# EAGLE schematic FRIDAY_Compute_SCH4b (EAGLE 9.6.2), part 3 of 3
## Sheet 10 of 11
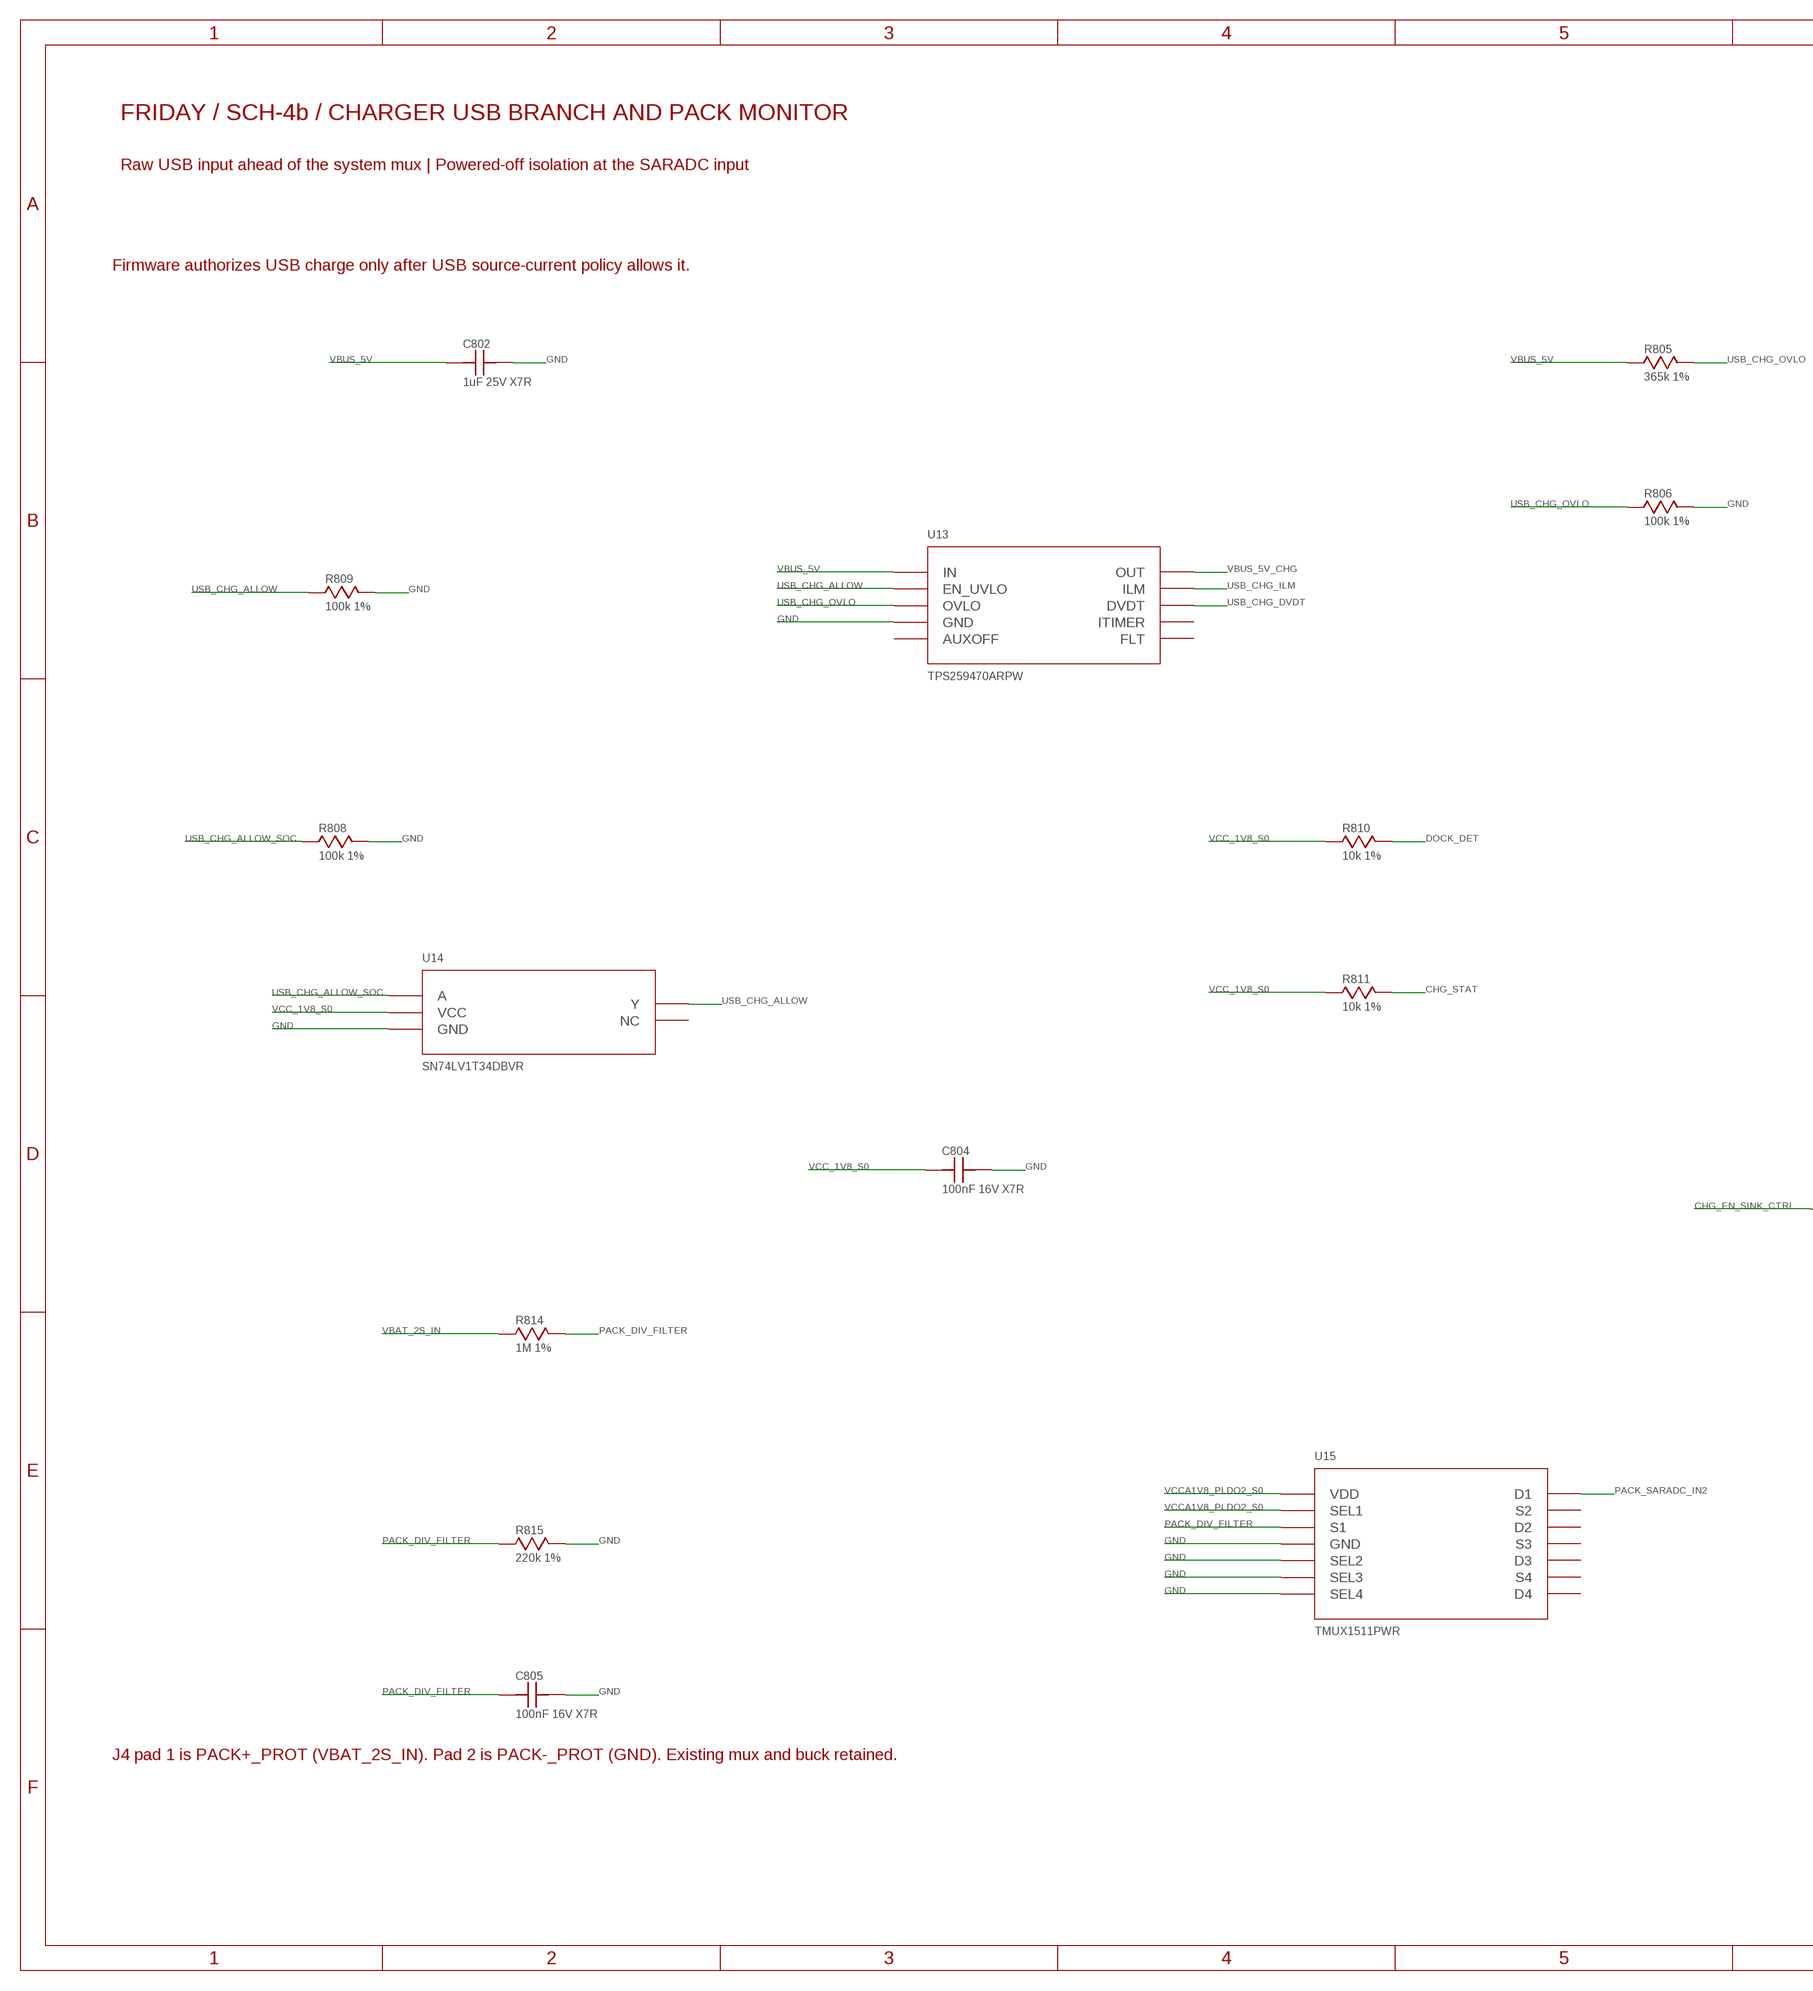
[diagram p27: schematic, sheet 10, part 1 of 2]
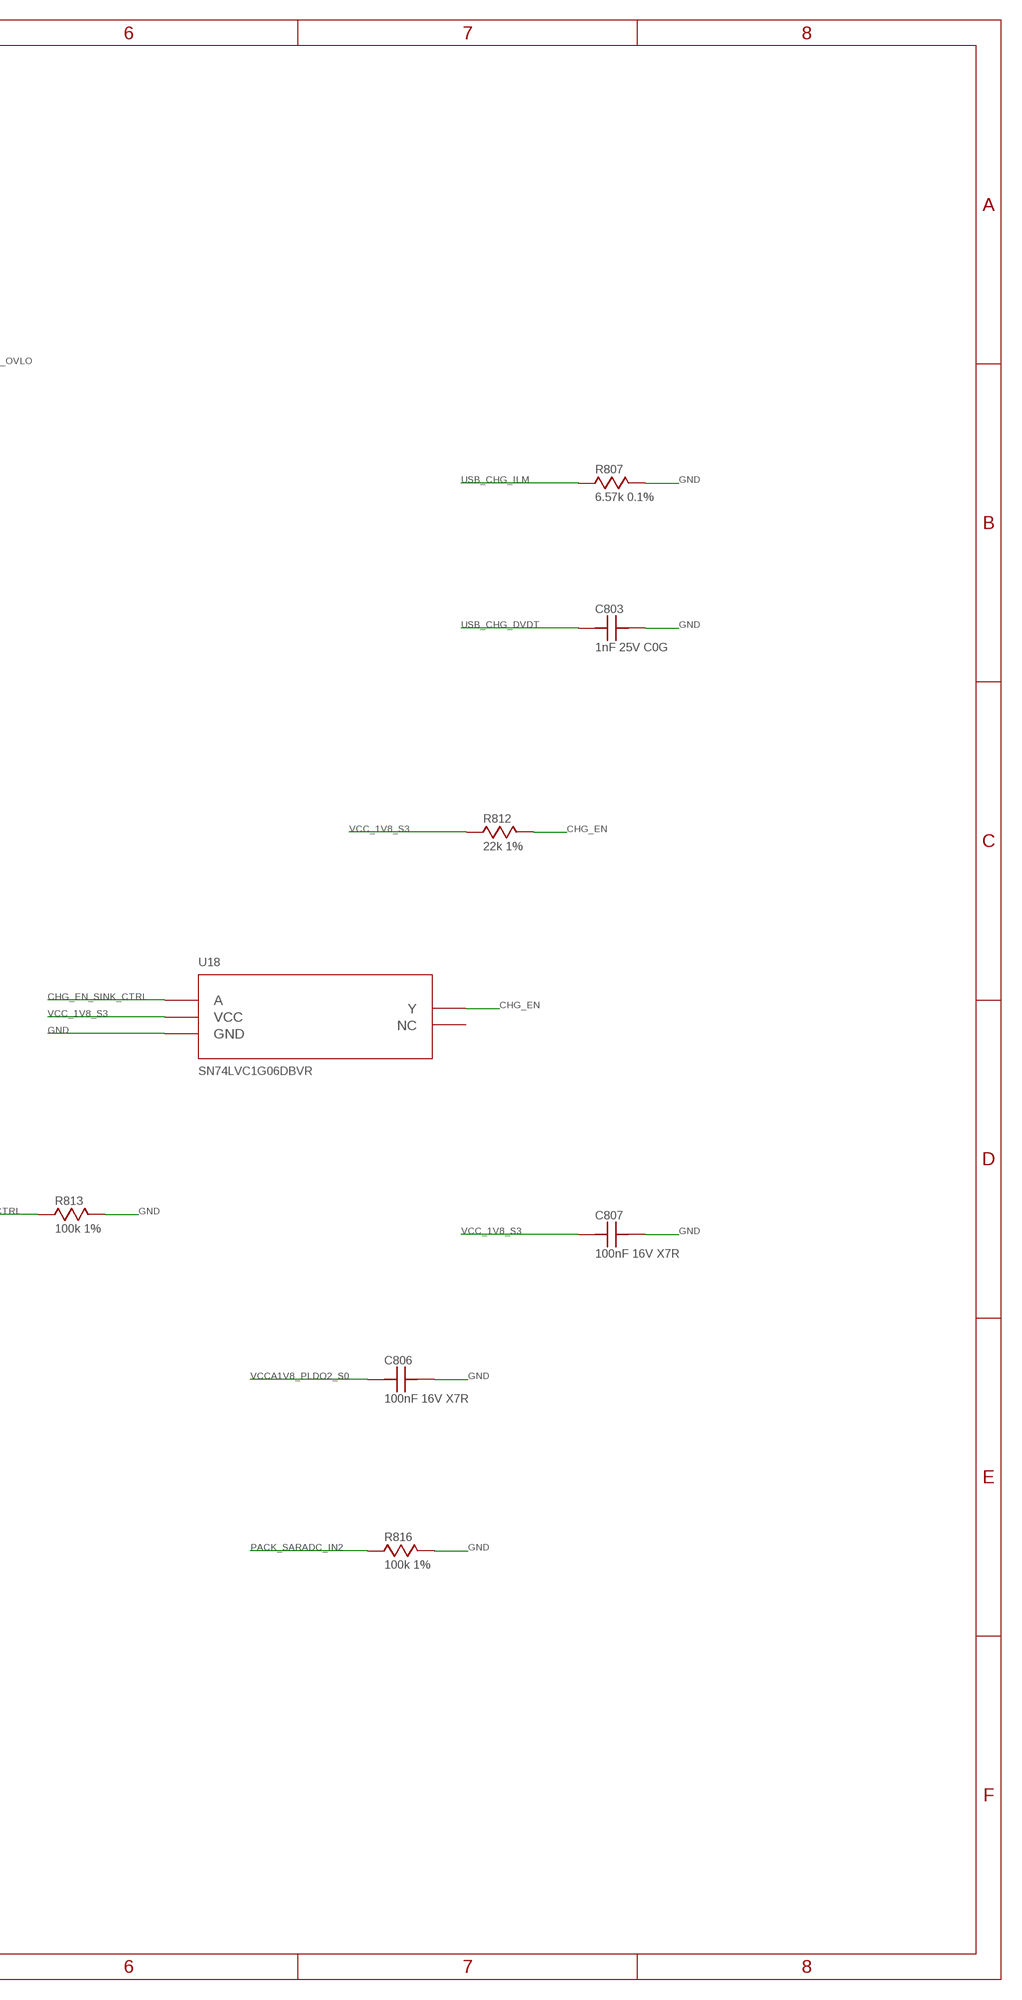
[diagram p28: schematic, sheet 10, part 2 of 2]

### Parts
C802  1uF 25V X7R  C_0603  [C0603]
C803  1nF 25V C0G  C_0603  [C0603]
C804  100nF 16V X7R  C_0603  [C0603]
C805  100nF 16V X7R  C_0603  [C0603]
C806  100nF 16V X7R  C_0603  [C0603]
C807  100nF 16V X7R  C_0603  [C0603]
R805  365k 1%  R_0603  [R0603]
R806  100k 1%  R_0603  [R0603]
R807  6.57k 0.1%  R_0603  [R0603]
R808  100k 1%  R_0603  [R0603]
R809  100k 1%  R_0603  [R0603]
R810  10k 1%  R_0603  [R0603]
R811  10k 1%  R_0603  [R0603]
R812  22k 1%  R_0603  [R0603]
R813  100k 1%  R_0603  [R0603]
R814  1M 1%  R_0603  [R0603]
R815  220k 1%  R_0603  [R0603]
R816  100k 1%  R_0603  [R0603]
U13  TPS259470ARPW  TPS259470  [TI_RPW0010A]
U14  SN74LV1T34DBVR  SN74LV1T34  [SOT23_DBV]
U15  TMUX1511PWR  TMUX1511  [TI_PW14_TSSOP]
U18  SN74LVC1G06DBVR  SN74LVC1G06  [SOT23_DBV]

### Nets
CHG_EN: R812.2 U18.4(Y) ; also sheet 9
CHG_EN_SINK_CTRL: R813.1 U18.2(A) ; also sheet 5
CHG_STAT: R811.2 ; also sheet 5,9
DOCK_DET: R810.2 ; also sheet 5,9
GND: C802.2 C803.2 C804.2 C805.2 C806.2 C807.2 R806.2 R807.2 R808.2 R809.2 R813.2 R815.2 R816.2 U13.8(GND) U14.3(GND) U15.4(SEL2) U15.7(GND) U15.10(SEL3) U15.13(SEL4) U18.3(GND) ; also sheet 1,2,3,4,5,6,7,8,9,11
PACK_DIV_FILTER: C805.1 R814.2 R815.1 U15.2(S1)
PACK_SARADC_IN2: R816.1 U15.3(D1) ; also sheet 5
USB_CHG_ALLOW: R809.1 U13.1(EN_UVLO) U14.4(Y)
USB_CHG_ALLOW_SOC: R808.1 U14.2(A) ; also sheet 5
USB_CHG_DVDT: C803.1 U13.7(DVDT)
USB_CHG_ILM: R807.1 U13.9(ILM)
USB_CHG_OVLO: R805.2 R806.1 U13.2(OVLO)
VBAT_2S_IN: R814.1 ; also sheet 1
VBUS_5V: C802.1 R805.1 U13.5(IN) ; also sheet 1
VBUS_5V_CHG: U13.6(OUT) ; also sheet 9
VCC_1V8_S0: C804.1 R810.1 R811.1 U14.5(VCC) ; also sheet 3,4,5,7,8,9
VCC_1V8_S3: C807.1 R812.1 U18.5(VCC) ; also sheet 2,3,4,5,7
VCCA1V8_PLDO2_S0: C806.1 U15.1(SEL1) U15.14(VDD) ; also sheet 2,5
Unconnected: U13.3(AUXOFF) U13.4(FLT) U13.10(ITIMER) U14.1(NC) U15.5(S2) U15.6(D2) U15.8(D3) U15.9(S3) U15.11(D4) U15.12(S4) U18.1(NC)

### Notes on the sheet
- FRIDAY / SCH-4b / CHARGER USB BRANCH AND PACK MONITOR
- Raw USB input ahead of the system mux | Powered-off isolation at the SARADC input
- Firmware authorizes USB charge only after USB source-current policy allows it.
- J4 pad 1 is PACK+_PROT (VBAT_2S_IN). Pad 2 is PACK-_PROT (GND). Existing mux and buck retained.

## Sheet 11 of 11
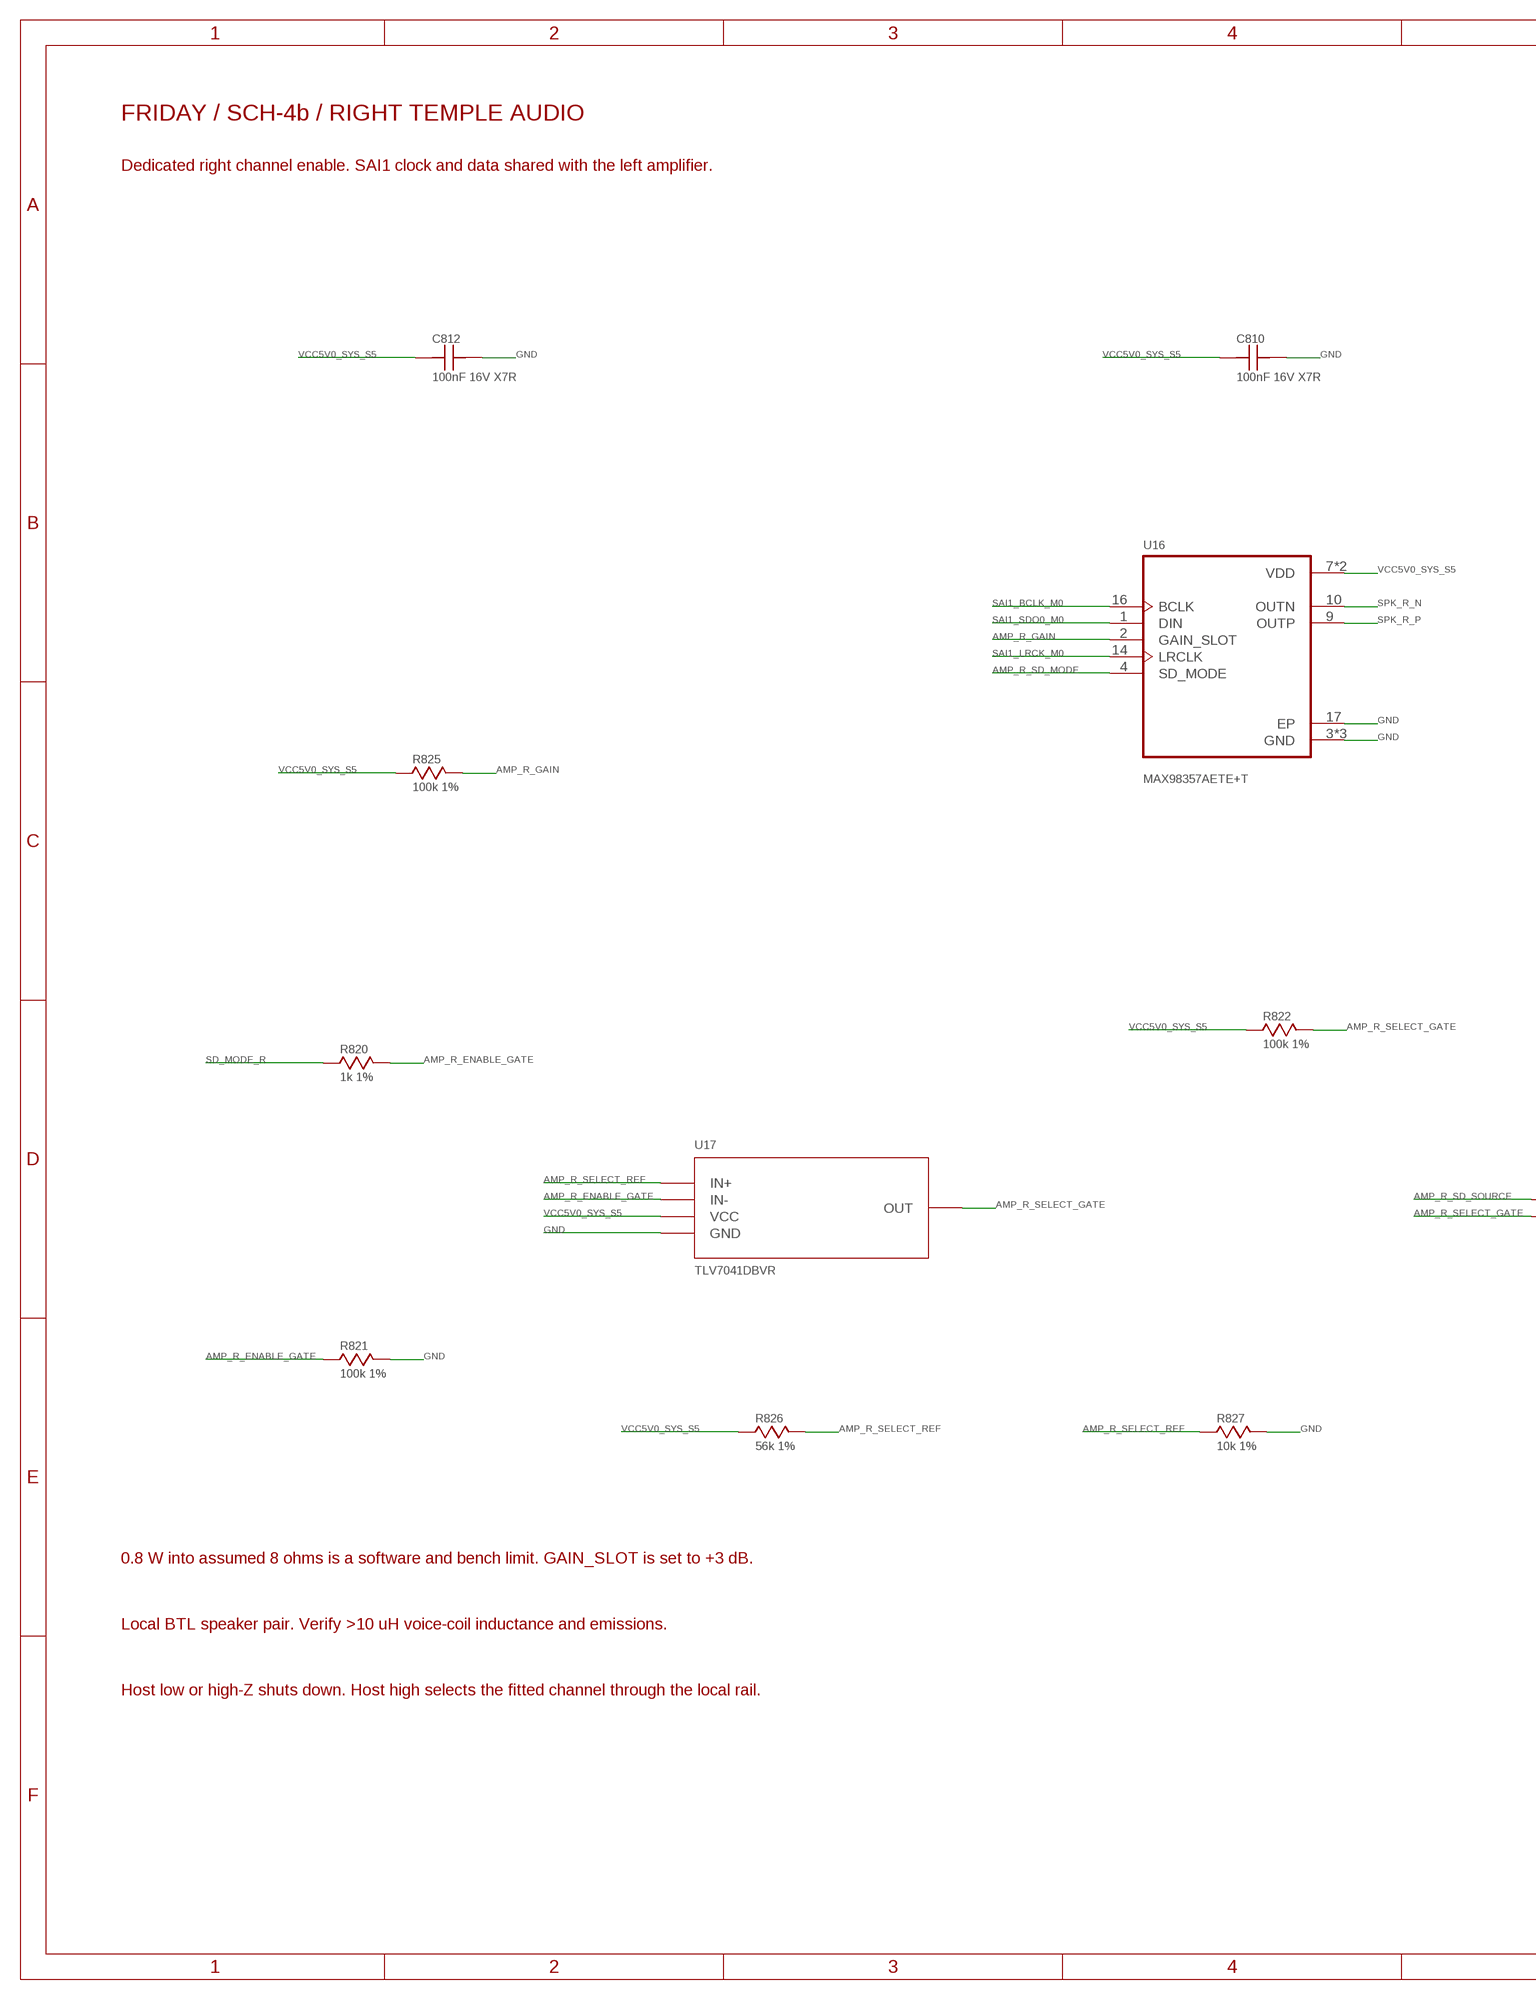
[diagram p29: schematic, sheet 11, part 1 of 2]
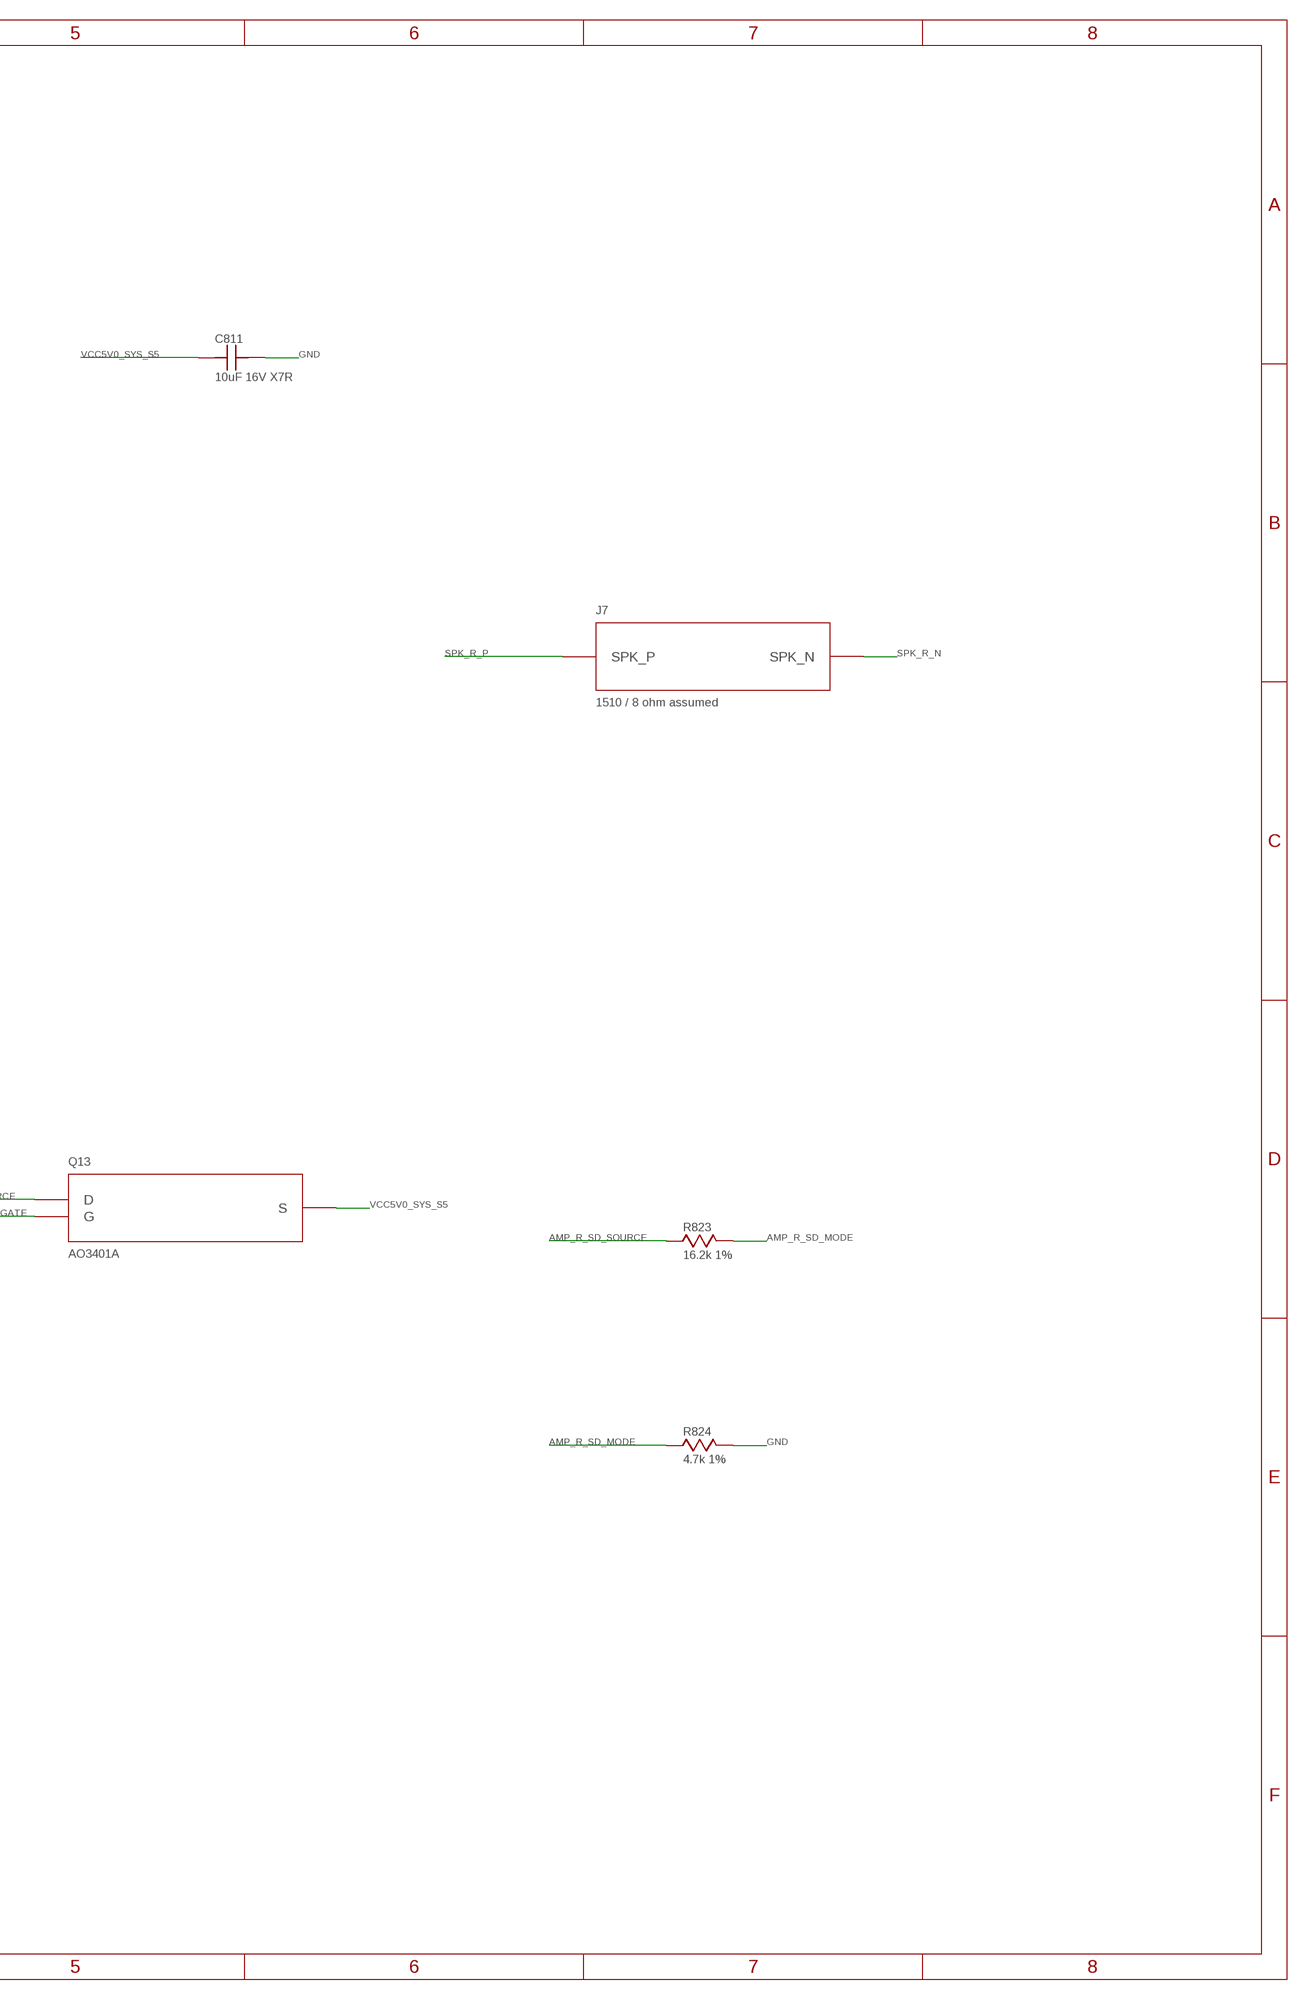
[diagram p30: schematic, sheet 11, part 2 of 2]

### Parts
C810  100nF 16V X7R  C_0603  [C0603]
C811  10uF 16V X7R  C_0805  [C0805]
C812  100nF 16V X7R  C_0603  [C0603]
J7  1510 / 8 ohm assumed  BTL_SPEAKER  [FRIDAY_SPEAKER_SOLDER_LANDS]
Q13  AO3401A  [SOT23_3]
R820  1k 1%  R_0603  [R0603]
R821  100k 1%  R_0603  [R0603]
R822  100k 1%  R_0603  [R0603]
R823  16.2k 1%  R_0603  [R0603]
R824  4.7k 1%  R_0603  [R0603]
R825  100k 1%  R_0603  [R0603]
R826  56k 1%  R_0603  [R0603]
R827  10k 1%  R_0603  [R0603]
U16  MAX98357AETE+T  [QFN50P300X300X80-17N]
U17  TLV7041DBVR  TLV7041  [TI_DBV_SOT23_5]

### Nets
AMP_R_ENABLE_GATE: R820.2 R821.1 U17.4(IN-)
AMP_R_GAIN: R825.2 U16.2(GAIN_SLOT)
AMP_R_SD_MODE: R823.2 R824.1 U16.4(SD_MODE)
AMP_R_SD_SOURCE: Q13.3(D) R823.1
AMP_R_SELECT_GATE: Q13.1(G) R822.2 U17.1(OUT)
AMP_R_SELECT_REF: R826.2 R827.1 U17.3(IN+)
GND: C810.2 C811.2 C812.2 R821.2 R824.2 R827.2 U16.3(GND) U16.11(GND) U16.15(GND) U16.17(EP) U17.2(GND) ; also sheet 1,2,3,4,5,6,7,8,9,10
SAI1_BCLK_M0: U16.16(BCLK) ; also sheet 9
SAI1_LRCK_M0: U16.14(LRCLK) ; also sheet 9
SAI1_SDO0_M0: U16.1(DIN) ; also sheet 5,9
SD_MODE_R: R820.1 ; also sheet 5
SPK_R_N: J7.2(SPK_N) U16.10(OUTN)
SPK_R_P: J7.1(SPK_P) U16.9(OUTP)
VCC5V0_SYS_S5: C810.1 C811.1 C812.1 Q13.2(S) R822.1 R825.1 R826.1 U16.7(VDD) U16.8(VDD) U17.5(VCC) ; also sheet 1,2,3,9

### Notes on the sheet
- FRIDAY / SCH-4b / RIGHT TEMPLE AUDIO
- Dedicated right channel enable. SAI1 clock and data shared with the left amplifier.
- 0.8 W into assumed 8 ohms is a software and bench limit. GAIN_SLOT is set to +3 dB.
- Local BTL speaker pair. Verify >10 uH voice-coil inductance and emissions.
- Host low or high-Z shuts down. Host high selects the fitted channel through the local rail.

## Library data of the parts
C1 C2 C35-C42 C81 C82 C100-C105 C110 C1303 C1306 C2311 C2317 C2329 C2334 C2351 C2352 C2357 C2360-C2363 C2365-C2370 C2372 C2402 C2403 C2405 C2407 C3801 C3810-C3812 C3825 C4000-C4003 = FRIDAY_SCH1_Support:C_0402
C7-C10 C13 C811 C1040 = FRIDAY_SCH1_Support:C_0805
C11 C12 C14-C18 C47 C48 C53-C68 C71-C80 C85 C86 C106 C107 C111 C801-C807 C810 C812 C1007 C1013 C1021 C1030 C1031 C1037-C1039 C1204 C1205 C1210 C1211 C2410-C2413 C2423 C3800 C3806-C3809 C3823 C3824 = FRIDAY_SCH1_Support:C_0603
C83 C84 = FRIDAY_SCH1_Support:C_0603; LCSC: C15850
C1000-C1005 C1009-C1011 C1015-C1018 C1023 C1024 C1026-C1028 C1032-C1035 C1102-C1108 C1116-C1119 C1200-C1202 C1206-C1208 C1212-C1214 C1300 C1302 C1305 C1308 C1309 C1400-C1403 C1405 C1406 C1408 C1503-C1506 C1509 C1801 C1802 C1901 C1903 C3802-C3805 C3813-C3822 C3826-C3842 C4004 = FRIDAY_SCH1_Support:C_0201
C1006 C1012 C1020 C1029 C1036 C1203 C1209 = FRIDAY_SCH1_Support:C_0402_BGA
D1 = USBLC6-2SC6:USBLC6-2SC6; DATASHEET_URL: https://s3.amazonaws.com/snapeda/datasheet/USBLC6-2SC6_STMicroelectronics.pdf; DESCRIPTION: 17V Clamp 5A (8/20µs) Ipp Tvs Diode Surface Mount SOT-23-6; MANUFACTURER: STMicroelectronics; MPN: USBLC6-2SC6; PACKAGE: SOT-23-6 STMicroelectronics; SOURCE_URL: https://www.snapeda.com/parts/USBLC6-2SC6/STMicroelectronics/view-part/
D2 = FRIDAY_SCH1_Support:TVS_VBUS; SPEC: Unidir 5.0V/6.0V VBUS TVS
D3 = FRIDAY_SCH1_Support:PSUR1610DNV07; EVB: D2300; MPN: PSUR1610DNV07
D2301 = FRIDAY_SCH1_Support:B5819WS
J1 = TYPE-C-31-M-12:TYPE-C-31-M-12; DATASHEET_URL: https://snapeda.s3.amazonaws.com/datasheet/2205251630_Korean-Hroparts-Elec-TYPE-C-31-M-12_C165948.pdf; DESCRIPTION: USB Connectors 24 Receptacle 1 8.94*7.3mm RoHS; LCSC: C165948; MANUFACTURER: HRO Electronics Co., Ltd.; MAXIMUM_PACKAGE_HEIGHT: 3.26 mm; MPN: TYPE-C-31-M-12; PARTREV: 2020.12.08; Package: Package; SOURCE_URL: https://www.snapeda.com/parts/TYPE-C-31-M-12/HRO+Electronics+Co.%252C+Ltd./view-part/; STANDARD: Manufacturer Recommendations
J4 = FRIDAY_SCH1_Support:BATT_PADS_2PIN; LCSC: N/A; MPN: SMD_PADS_2.5x3.0mm
J5 J6 = FH12-24S-0.5SH_55_:FH12-24S-0.5SH(55); DATASHEET_URL: https://s3.amazonaws.com/snapeda/datasheet/FH12-24S-05SH-55-_Hirose.pdf; DESCRIPTION: 24 Position FFC, FPC Connector Contacts, Bottom 0.020" (0.50mm) Surface Mount, Right Angle; MANUFACTURER: Hirose; MAXIMUM_PACKAGE_HEIGHT: 2.2mm; MPN: FH12-24S-0.5SH(55); SOURCE_URL: https://www.snapeda.com/parts/FH12-24S-0.5SH(55)/Hirose+Electric+Co+Ltd/view-part/; STANDARD: Manufacturer recommendations
J7 = FRIDAY_SCH4b_Audio:BTL_SPEAKER
L1-L10 = FRIDAY_SCH1_Support:IND_2016
L11 L12 = FRIDAY_SCH1_Support:IND_2520
L13 = FRIDAY_SCH1_Support:IND_4040; SPEC: Isat>=6.5A DCR<25mR
PWR1 PWR3 PWR5 = FRIDAY_SCH1_Support:VBAT_2S_IN
PWR9 PWR11 PWR13 PWR15 PWR30 PWR36 = FRIDAY_SCH1_Support:VBAT_BUCK_5V
PWR19 PWR21 PWR23 PWR25 PWR28 PWR32 PWR34 = FRIDAY_SCH1_Support:VBUS_5V
PWR40 PWR41 PWR43 PWR45 PWR57 PWR65 PWR77 PWR85 PWR93 PWR101 PWR111 PWR117 PWR125 PWR137 PWR165 PWR167 PWR173 PWR176 PWR185 = FRIDAY_SCH1_Support:VCC5V0_SYS_S5
PWR47 PWR49 PWR51 PWR53 PWR55 PWR205 PWR207 PWR209 PWR211 PWR213 PWR215 PWR217 PWR219 = FRIDAY_SCH1_Support:VDD_CPU_BIG_S0
PWR59 PWR61 PWR63 PWR261 PWR263 PWR265 PWR267 PWR269 PWR271 PWR273 PWR275 = FRIDAY_SCH1_Support:VDD_NPU_S0
PWR67 PWR69 PWR71 PWR73 PWR75 PWR221 PWR223 PWR225 PWR227 PWR229 = FRIDAY_SCH1_Support:VDD_CPU_LIT_S0
PWR79 PWR81 PWR83 PWR199 PWR332 = FRIDAY_SCH1_Support:VCC_3V3_S3
PWR87 PWR89 PWR91 PWR247 PWR249 PWR251 PWR253 PWR255 PWR257 PWR259 = FRIDAY_SCH1_Support:VDD_GPU_S0
PWR95 PWR97 PWR99 PWR277 PWR279 PWR281 PWR283 PWR285 PWR287 = FRIDAY_SCH1_Support:VDDQ_DDR_S0
PWR103 PWR105 PWR107 PWR109 PWR231 PWR233 PWR235 PWR237 PWR239 PWR241 PWR243 PWR245 = FRIDAY_SCH1_Support:VDD_LOGIC_S0
PWR113 PWR115 PWR194 PWR330 PWR360 = FRIDAY_SCH1_Support:VCC_1V8_S3
PWR127 PWR129 PWR131 PWR133 PWR289 PWR291 PWR293 PWR295 PWR297 PWR299 = FRIDAY_SCH1_Support:VDD_DDR_S0
PWR135 PWR179 PWR181 PWR183 = FRIDAY_SCH1_Support:VCC_2V0_PLDO_S3
PWR139 PWR141 PWR188 PWR190 PWR192 = FRIDAY_SCH1_Support:VCC_1V1_NLDO_S3
PWR143 PWR317 PWR319 PWR321 = FRIDAY_SCH1_Support:VCCA_1V8_S0
PWR145 = FRIDAY_SCH1_Support:VCCA1V8_PLDO2_S0
PWR147 PWR328 = FRIDAY_SCH1_Support:VDDA_1V2_S0
PWR149 = FRIDAY_SCH1_Support:VCCA_3V3_S0
PWR151 PWR340 = FRIDAY_SCH1_Support:VCCIO_SD_S0
PWR153 PWR307 PWR309 = FRIDAY_SCH1_Support:VDD_0V75_S3
PWR155 PWR303 = FRIDAY_SCH1_Support:VDDA_DDR_PLL_S0
PWR157 = FRIDAY_SCH1_Support:VDDA0V75_HDMI_S0
PWR159 = FRIDAY_SCH1_Support:VDDA_0V85_S0
PWR161 PWR311 PWR313 PWR315 = FRIDAY_SCH1_Support:VDDA_0V75_S0
PWR163 PWR169 PWR170 = FRIDAY_SCH1_Support:VCCA1V8_PLDO6_S3
PWR197 PWR336 PWR338 = FRIDAY_SCH1_Support:VCC_1V8_S0
PWR202 PWR342 PWR344 PWR346 = FRIDAY_SCH1_Support:VCC_3V3_S0
PWR305 = FRIDAY_SCH1_Support:DDR_PLL_AVDD1V8
PWR323 PWR325 = FRIDAY_SCH1_Support:MIPI_DCPHY_AVDD
PWR352 = FRIDAY_SCH1_Support:OSC_1V8
PWR354 PWR356 = FRIDAY_SCH1_Support:SARADC_AVDD1V8
Q13 = FRIDAY_SCH4b_Audio:AO3401A
R1 R2 R5 R6 R14 R16-R19 R21 R22 R24-R29 R31 R32 R37 R100-R111 R1105 R1202 R2302 R2304 R2305 R2314 R2320 R2321 R2324 R2330 R2332 R2405 R2406 R2411-R2414 R9006 = FRIDAY_SCH1_Support:R_0402
R801-R816 R820-R827 R1119 R1147 R1320 R1323 R1502 R2427 R3809 = FRIDAY_SCH1_Support:R_0603
R1106 R1107 R1112 R1114 R1116 R1122 R1123 R1200 R1201 R1400-R1402 R3802 R3804 R4000-R4010 R9905 R9906 = FRIDAY_SCH1_Support:R_0201
SW1 SW2 = TS-1187A-B-A-B:TS-1187A-B-A-B; DATASHEET_URL: https://snapeda.s3.amazonaws.com/datasheets753-1901111503_XKB-Enterprise-TS-1187A-B-A-B_C318884.pdf; DESCRIPTION: Tact swicth.; LCSC: C318884; MANUFACTURER: XKB Industrial Precision; MAXIMUM_PACKAGE_HEIGHT: 1.5mm; MPN: TS-1187A-B-A-B; PARTREV: A0; Package: Package; SOURCE_URL: https://www.snapeda.com/parts/TS-1187A-B-A-B/XKB+Connection/view-part/; STANDARD: Manufacturer Recommendations
TP1-TP3 TP801-TP803 TP2318 = FRIDAY_SCH1_Support:TP_1MM
U1 = RK3576:RK3576; FOOTPRINT_STATUS: UNVERIFIED vs RK3576 DS s2; LCSC: C42388007; MPN: RK3576
U2 = RK806-1:RK806-1; DESCRIPTION: RK806-1 Power Management IC; LCSC: C49174044 (UNVERIFIED); MANUFACTURER: rockchip; MAXIMUM_PACKAGE_HEIGHT: 0.90mm; MPN: RK806S-5; PARTREV: 1.3; SOURCE_URL: https://www.snapeda.com/parts/RK806-1/Rockchip/view-part/; STANDARD: IPC-7351B
U5 = TPS2121RUXR:TPS2121RUXR; DATASHEET_URL: https://s3.amazonaws.com/snapeda/datasheet/TPS2121RUXR_Texas_Instruments.pdf; DESCRIPTION: 2.7-V&nbsp;to 22-V, 56-mΩ, 4.5-A, power mux with seamless switchover; MANUFACTURER: Texas Instruments; MPN: TPS2121RUXR; Package: VQFN-HR-12 Texas Instruments; SOURCE_URL: https://www.snapeda.com/parts/TPS2121RUXR/Texas+Instruments/view-part/; STANDARD: Manufacturer Recommendations
U6 U7 = FRIDAY_SCH1_Support:TMI3112H; LCSC: C2985060; MPN: TMI3112H
U8 = SY6280AAC:SY6280AAC; DATASHEET_URL: https://snapeda.s3.amazonaws.com/datasheets/SY6280AAC.PDF; DESCRIPTION: Power/protection Switch; LCSC: C55136; MANUFACTURER: Silergy; MAXIMUM_PACKAGE_HEIGHT: 1.3 mm; MPN: SY6280AAC; PARTREV: 1.0C; Package: SOT-23-5 Silergy; SNAPEDA_PACKAGE_ID: 29139; SOURCE_URL: https://www.snapeda.com/parts/SY6280AAC/Silergy/view-part/; STANDARD: IPC 7351B
U9 = FRIDAY_SCH1_Support:CW3301; MPN: CW3301
U10 = SY8205FCC:SY8205FCC; DATASHEET_URL: https://snapeda.s3.amazonaws.com/datasheets/2056-1809050154_Silergy-Corp-SY8205FCC_C111875.pdf; DESCRIPTION: High-Efficiency Fast Response，5A, 30V Input Synchronous Step Down Regulator; LCSC: C111875; MANUFACTURER: Silergy; MAXIMUM_PACKAGE_HEIGHT: 1.60 mm; MPN: SY8205FCC; PARTREV: 0.4; Package: Package; SOURCE_URL: https://www.snapeda.com/parts/SY8205FCC/Silergy/view-part/; STANDARD: Manufacturer Recommendations
U11 = H9HP52ACPMADAR:H9HP52ACPMADAR-KMM
U12 U14 = FRIDAY_SCH4b_Audio:SN74LV1T34
U13 = FRIDAY_SCH4b_Audio:TPS259470
U15 = FRIDAY_SCH4b_Audio:TMUX1511
U16 = MAX98357AETE_T:MAX98357AETE+T; DATASHEET_URL: https://s3.amazonaws.com/snapeda/datasheet/MAX98357AETE_T_Maxim_Integrated_Products.pdf; DESCRIPTION: Audio Amp Speaker 1-CH Mono 3.2W Class-D 16-Pin TQFN EP T/R; MANUFACTURER: Analog Devices; MPN: MAX98357AETE+T; Package: TQFN-16 Maxim; SOURCE_URL: https://www.snapeda.com/parts/MAX98357AETE+T/Analog+Devices/view-part/
U17 = FRIDAY_SCH4b_Audio:TLV7041
U18 = FRIDAY_SCH4b_Audio:SN74LVC1G06
Y1 = X322524MOB4SI_24MHz:X322524MSB4SI; Copyright: Copyright (C) 2026 Ultra Librarian. All rights reserved.; LCSC: C70590; MPN: X322524MOB4SI; Manufacturer_Name: YXC; Manufacturer_Part_Number: X322524MSB4SI